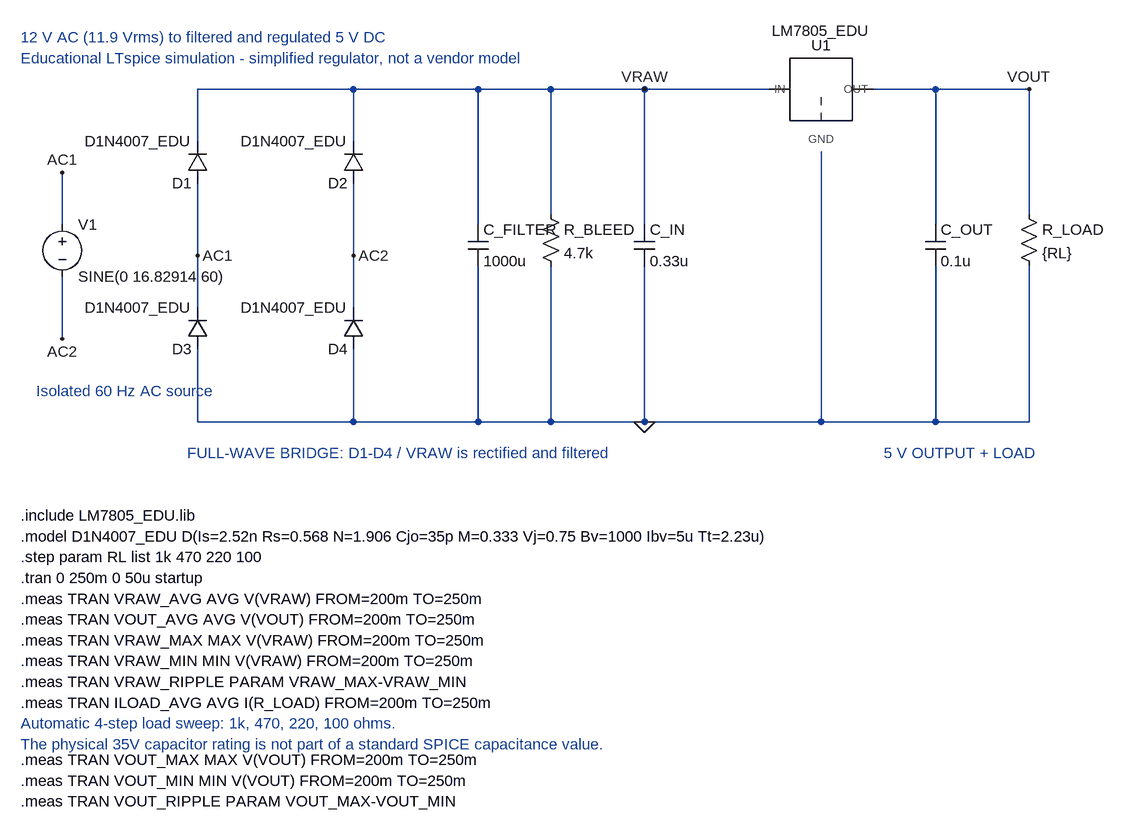
[diagram p0: schematic AC_DC_5V_Power_Supply.asc]
AC_DC_5V_Power_Supply.asc, the LTspice schematic file:
Version 4.1
SHEET 1 1792 1344
WIRE 112 224 112 304
WIRE 112 384 112 480
WIRE 320 96 320 176
WIRE 320 240 320 352
WIRE 320 352 320 432
WIRE 320 496 320 608
WIRE 560 96 560 176
WIRE 560 240 560 352
WIRE 560 352 560 432
WIRE 560 496 560 608
WIRE 320 96 560 96
WIRE 560 96 752 96
WIRE 752 96 864 96
WIRE 864 96 1008 96
WIRE 1008 96 1200 96
WIRE 320 608 560 608
WIRE 560 608 752 608
WIRE 752 608 864 608
WIRE 864 608 1008 608
WIRE 1008 608 1280 608
WIRE 1280 608 1456 608
WIRE 1456 608 1600 608
WIRE 752 96 752 304
WIRE 752 368 752 608
WIRE 864 96 864 288
WIRE 864 368 864 608
WIRE 1008 96 1008 304
WIRE 1008 368 1008 608
WIRE 1280 192 1280 608
WIRE 1360 96 1456 96
WIRE 1456 96 1600 96
WIRE 1456 96 1456 304
WIRE 1456 368 1456 608
WIRE 1600 96 1600 288
WIRE 1600 368 1600 608
FLAG 112 224 AC1
FLAG 112 480 AC2
FLAG 320 352 AC1
FLAG 560 352 AC2
FLAG 1008 96 VRAW
FLAG 1600 96 VOUT
FLAG 1008 608 0
SYMBOL voltage 112 288 R0
SYMATTR InstName V1
SYMATTR Value SINE(0 16.82914 60)
SYMBOL diode 336 240 R180
SYMATTR InstName D1
SYMATTR Value D1N4007_EDU
SYMBOL diode 576 240 R180
SYMATTR InstName D2
SYMATTR Value D1N4007_EDU
SYMBOL diode 336 496 R180
SYMATTR InstName D3
SYMATTR Value D1N4007_EDU
SYMBOL diode 576 496 R180
SYMATTR InstName D4
SYMATTR Value D1N4007_EDU
SYMBOL cap 736 304 R0
SYMATTR InstName C_FILTER
SYMATTR Value 1000u
SYMBOL res 848 272 R0
SYMATTR InstName R_BLEED
SYMATTR Value 4.7k
SYMBOL cap 992 304 R0
SYMATTR InstName C_IN
SYMATTR Value 0.33u
SYMBOL LM7805_EDU 1280 96 R0
SYMATTR InstName U1
SYMATTR Value LM7805_EDU
SYMBOL cap 1440 304 R0
SYMATTR InstName C_OUT
SYMATTR Value 0.1u
SYMBOL res 1584 272 R0
SYMATTR InstName R_LOAD
SYMATTR Value {RL}
TEXT 48 16 Left 2 ;12 V AC (11.9 Vrms) to filtered and regulated 5 V DC
TEXT 48 48 Left 2 ;Educational LTspice simulation - simplified regulator, not a vendor model
TEXT 72 560 Left 2 ;Isolated 60 Hz AC source
TEXT 304 656 Left 2 ;FULL-WAVE BRIDGE: D1-D4 / VRAW is rectified and filtered
TEXT 1376 656 Left 2 ;5 V OUTPUT + LOAD
TEXT 48 752 Left 2 !.include LM7805_EDU.lib
TEXT 48 784 Left 2 !.model D1N4007_EDU D(Is=2.52n Rs=0.568 N=1.906 Cjo=35p M=0.333 Vj=0.75 Bv=1000 Ibv=5u Tt=2.23u)
TEXT 48 816 Left 2 !.step param RL list 1k 470 220 100
TEXT 48 848 Left 2 !.tran 0 250m 0 50u startup
TEXT 48 880 Left 2 !.meas TRAN VRAW_AVG AVG V(VRAW) FROM=200m TO=250m
TEXT 48 912 Left 2 !.meas TRAN VOUT_AVG AVG V(VOUT) FROM=200m TO=250m
TEXT 48 944 Left 2 !.meas TRAN VRAW_MAX MAX V(VRAW) FROM=200m TO=250m
TEXT 48 976 Left 2 !.meas TRAN VRAW_MIN MIN V(VRAW) FROM=200m TO=250m
TEXT 48 1008 Left 2 !.meas TRAN VRAW_RIPPLE PARAM VRAW_MAX-VRAW_MIN
TEXT 48 1040 Left 2 !.meas TRAN ILOAD_AVG AVG I(R_LOAD) FROM=200m TO=250m
TEXT 48 1128 Left 2 !.meas TRAN VOUT_MAX MAX V(VOUT) FROM=200m TO=250m
TEXT 48 1160 Left 2 !.meas TRAN VOUT_MIN MIN V(VOUT) FROM=200m TO=250m
TEXT 48 1192 Left 2 !.meas TRAN VOUT_RIPPLE PARAM VOUT_MAX-VOUT_MIN
TEXT 48 1072 Left 2 ;Automatic 4-step load sweep: 1k, 470, 220, 100 ohms.
TEXT 48 1104 Left 2 ;The physical 35V capacitor rating is not part of a standard SPICE capacitance value.

The netlist it stands for:
* AC_DC_5V_Power_Supply.asc
V1 AC1 AC2 SINE(0 16.82914 60)
D1 AC1 VRAW D1N4007_EDU
D2 AC2 VRAW D1N4007_EDU
D3 0 AC1 D1N4007_EDU
D4 0 AC2 D1N4007_EDU
C_FILTER VRAW 0 1000u
R_BLEED VRAW 0 4.7k
C_IN VRAW 0 0.33u
X§U1 VRAW 0 VOUT LM7805_EDU  ; pins IN GND OUT
C_OUT VOUT 0 0.1u
R_LOAD VOUT 0 {RL}
.model D D
.lib standard.dio
* 12 V AC (11.9 Vrms) to filtered and regulated 5 V DC
* Educational LTspice simulation - simplified regulator, not a vendor model
* Isolated 60 Hz AC source
* FULL-WAVE BRIDGE: D1-D4 / VRAW is rectified and filtered
* 5 V OUTPUT + LOAD
.include LM7805_EDU.lib
.model D1N4007_EDU D(Is=2.52n Rs=0.568 N=1.906 Cjo=35p M=0.333 Vj=0.75 Bv=1000 Ibv=5u Tt=2.23u)
.step param RL list 1k 470 220 100
.tran 0 250m 0 50u startup
.meas TRAN VRAW_AVG AVG V(VRAW) FROM=200m TO=250m
.meas TRAN VOUT_AVG AVG V(VOUT) FROM=200m TO=250m
.meas TRAN VRAW_MAX MAX V(VRAW) FROM=200m TO=250m
.meas TRAN VRAW_MIN MIN V(VRAW) FROM=200m TO=250m
.meas TRAN VRAW_RIPPLE PARAM VRAW_MAX-VRAW_MIN
.meas TRAN ILOAD_AVG AVG I(R_LOAD) FROM=200m TO=250m
.meas TRAN VOUT_MAX MAX V(VOUT) FROM=200m TO=250m
.meas TRAN VOUT_MIN MIN V(VOUT) FROM=200m TO=250m
.meas TRAN VOUT_RIPPLE PARAM VOUT_MAX-VOUT_MIN
* Automatic 4-step load sweep: 1k, 470, 220, 100 ohms.
* The physical 35V capacitor rating is not part of a standard SPICE capacitance value.
.backanno
.end

* Results of the author's LTspice run, read from the files saved beside the schematic
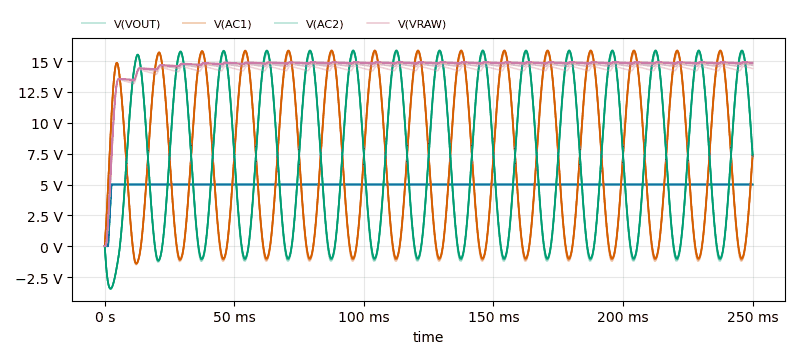
[diagram p1: Transient Analysis of AC_DC_5V_Power_Supply.asc, plotted from the saved traces]
* Transient Analysis, 4 runs:
*   V(VOUT) [rl=100]: min 0 V, max 4.996 V, average 4.957 V, rms 4.974 V, last 4.996 V
*   V(VOUT) [rl=220]: min 0 V, max 4.999 V, average 4.959 V, rms 4.977 V, last 4.998 V
*   V(VOUT) [rl=470]: min 0 V, max 4.999 V, average 4.96 V, rms 4.978 V, last 4.999 V
*   V(VOUT) [rl=1000]: min 0 V, max 5 V, average 4.961 V, rms 4.978 V, last 5 V
*   V(AC1) [rl=100]: min -1.491 V, max 15.66 V, average 7.102 V, rms 9.252 V, last 7.197 V
*   V(AC1) [rl=220]: min -1.433 V, max 15.76 V, average 7.221 V, rms 9.344 V, last 7.328 V
*   V(AC1) [rl=470]: min -1.407 V, max 15.83 V, average 7.288 V, rms 9.395 V, last 7.402 V
*   V(AC1) [rl=1000]: min -1.394 V, max 15.86 V, average 7.325 V, rms 9.424 V, last 7.445 V
*   V(AC2) [rl=100]: min -3.448 V, max 15.66 V, average 7.102 V, rms 9.322 V, last 7.197 V
*   V(AC2) [rl=220]: min -3.444 V, max 15.76 V, average 7.221 V, rms 9.416 V, last 7.328 V
*   V(AC2) [rl=470]: min -3.443 V, max 15.83 V, average 7.288 V, rms 9.468 V, last 7.402 V
*   V(AC2) [rl=1000]: min -3.442 V, max 15.86 V, average 7.325 V, rms 9.498 V, last 7.445 V
*   V(VRAW) [rl=100]: min 0 V, max 14.59 V, average 14.2 V, rms 14.26 V, last 14.39 V
*   V(VRAW) [rl=220]: min 0 V, max 14.76 V, average 14.44 V, rms 14.5 V, last 14.66 V
*   V(VRAW) [rl=470]: min 0 V, max 14.87 V, average 14.58 V, rms 14.64 V, last 14.8 V
*   V(VRAW) [rl=1000]: min 0 V, max 14.94 V, average 14.65 V, rms 14.71 V, last 14.89 V
* From the log:
*   Measurement: vraw_avg
*     step  AVG(V(VRAW))  FROM  TO
*        1  14.4021033832  0.2  0.25
*        2  14.658059293  0.2  0.25
*        3  14.804936832  0.2  0.25
*        4  14.8900988045  0.2  0.25
*   Measurement: vout_avg
*     step  AVG(V(VOUT))  FROM  TO
*        1  4.99600320875  0.2  0.25
*        2  4.99818246673  0.2  0.25
*        3  4.99914907469  0.2  0.25
*        4  4.99960000514  0.2  0.25
*   Measurement: vraw_max
*     step  MAX(V(VRAW))  FROM  TO
*        1  14.5933036804  0.2  0.25
*        2  14.7626161575  0.2  0.25
*        3  14.8696136475  0.2  0.25
*        4  14.9357843399  0.2  0.25
*   Measurement: vraw_min
*     step  MIN(V(VRAW))  FROM  TO
*        1  14.2078704834  0.2  0.25
*        2  14.5524053574  0.2  0.25
*        3  14.7397890091  0.2  0.25
*        4  14.844165802  0.2  0.25
*   Measurement: vraw_ripple
*     step  VRAW_MAX-VRAW_MIN
*        1  0.385433197021
*        2  0.210210800171
*        3  0.129824638367
*        4  0.0916185379028
*   Measurement: iload_avg
*     step  AVG(I(R_LOAD))  FROM  TO
*        1  0.0499600320201  0.2  0.25
*        2  0.022719011277  0.2  0.25
*        3  0.0106364873748  0.2  0.25
*        4  0.00499960001142  0.2  0.25
*   Measurement: vout_max
*     step  MAX(V(VOUT))  FROM  TO
*        1  4.99600458145  0.2  0.25
*        2  4.99818515778  0.2  0.25
*        3  4.99915075302  0.2  0.25
*        4  4.99960136414  0.2  0.25
*   Measurement: vout_min
*     step  MIN(V(VOUT))  FROM  TO
*        1  4.99600172043  0.2  0.25
*        2  4.99817991257  0.2  0.25
*        3  4.99914741516  0.2  0.25
*        4  4.99959850311  0.2  0.25
*   Measurement: vout_ripple
*     step  VOUT_MAX-VOUT_MIN
*        1  2.86102294922e-06
*        2  5.24520874023e-06
*        3  3.33786010742e-06
*        4  2.86102294922e-06